# Altium project P.PrjPcb
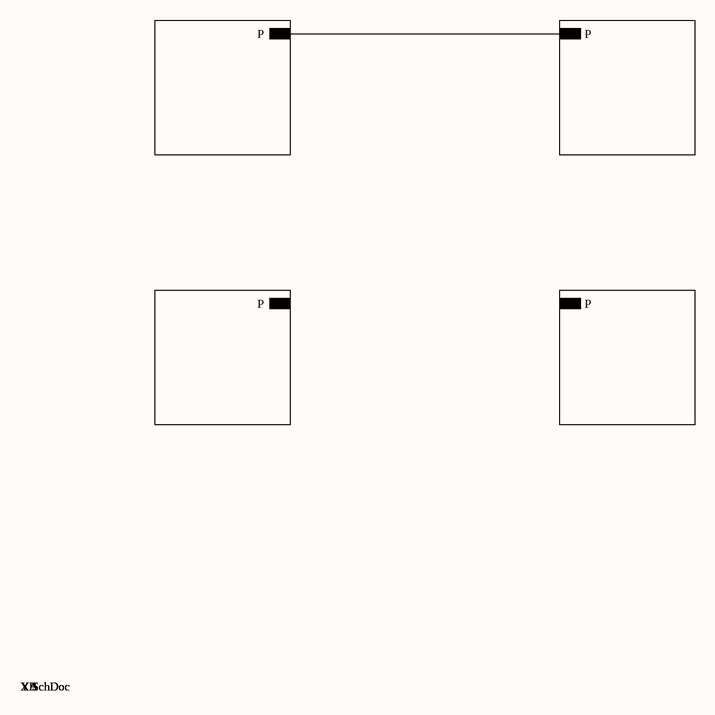
[diagram p0: Top.SchDoc]
3 sheets, 4 parts. Net scope: hierarchical (ports join the sheet entries above them; power ports are global).
Sheets:
  Top.SchDoc
    XA = X.SchDoc
    XB = X.SchDoc
    YA = Y.SchDoc
    YB = Y.SchDoc

## Sheet Top.SchDoc
size A4

### Sub-sheets
XA = X.SchDoc: P
XB = X.SchDoc: P
YA = Y.SchDoc: P
YB = Y.SchDoc: P

### Nets
SIG: sheet XA/P, sheet YA/P

## Sheet X.SchDoc
size A4
Used 2 times, as channels XA, XB. Parts and nets are listed once, with the designators drawn on the sheet.
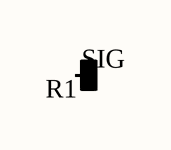
[diagram p1: X.SchDoc]

### Parts
R1  (no value)

### Ports
P

### Nets
SIG: R1.1(A) ; port P

### Channels
XA: designators end in _XA; ports P=SIG
XB: designators end in _XB; ports P=SIG_XB

### Library data of the parts
R1 = RES

## Sheet Y.SchDoc
size A4
Used 2 times, as channels YA, YB. Parts and nets are listed once, with the designators drawn on the sheet.
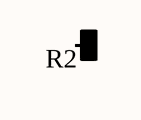
[diagram p2: Y.SchDoc]

### Parts
R2  (no value)

### Ports
P

### Nets
P: R2.1(A) ; port P

### Channels
YA: designators end in _YA; ports P=SIG
YB: designators end in _YB; ports P=NetR2_YB_1

### Library data of the parts
R2 = RES

## Nets that join several sheets
SIG: XA (R1_XA.1), YA (R2_YA.1)